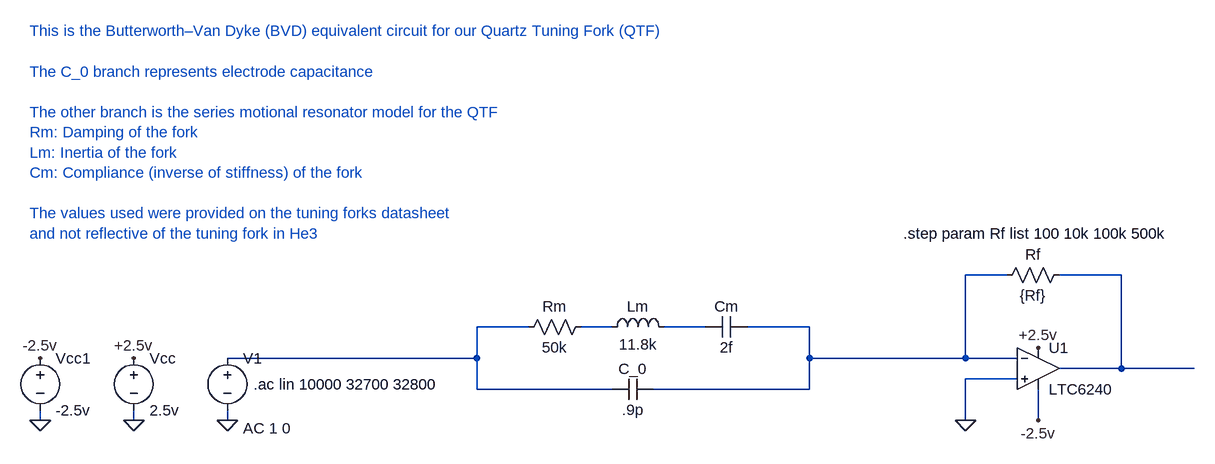
[diagram p0: schematic TuningForkModel.asc]
TuningForkModel.asc, the LTspice schematic file:
Version 4.1
SHEET 1 2036 680
WIRE 1440 16 1376 16
WIRE 1616 16 1520 16
WIRE 704 96 624 96
WIRE 832 96 784 96
WIRE 976 96 912 96
WIRE 1136 96 1040 96
WIRE 624 144 624 96
WIRE 624 144 240 144
WIRE 1136 144 1136 96
WIRE 1376 144 1376 16
WIRE 1376 144 1136 144
WIRE 1456 144 1376 144
WIRE 1616 160 1616 16
WIRE 1616 160 1520 160
WIRE 1728 160 1616 160
WIRE 1456 176 1376 176
WIRE 624 192 624 144
WIRE 832 192 624 192
WIRE 1136 192 1136 144
WIRE 1136 192 896 192
WIRE -48 240 -48 224
WIRE 96 240 96 224
WIRE 240 240 240 224
WIRE 1376 240 1376 176
WIRE 1488 240 1488 192
FLAG 96 144 +2.5v
FLAG 1376 240 0
FLAG 240 240 0
FLAG 96 240 0
FLAG -48 144 -2.5v
FLAG -48 240 0
FLAG 1488 240 -2.5v
FLAG 1488 128 +2.5v
SYMBOL voltage 240 128 R0
WINDOW 123 24 124 Left 2
WINDOW 39 0 0 Left 0
SYMATTR Value2 AC 1 0
SYMATTR InstName V1
SYMATTR Value ""
SYMBOL res 800 80 R90
WINDOW 0 0 56 VBottom 2
WINDOW 3 32 56 VTop 2
SYMATTR InstName Rm
SYMATTR Value 50k
SYMBOL ind 816 112 R270
WINDOW 0 32 56 VTop 2
WINDOW 3 5 56 VBottom 2
SYMATTR InstName Lm
SYMATTR Value 11.8k
SYMATTR SpiceLine Rser=1m
SYMBOL cap 1040 80 R90
WINDOW 0 0 32 VBottom 2
WINDOW 3 32 32 VTop 2
SYMATTR InstName Cm
SYMATTR Value 2f
SYMBOL cap 832 208 R270
WINDOW 0 32 32 VTop 2
WINDOW 3 0 32 VBottom 2
SYMATTR InstName C_0
SYMATTR Value .9p
SYMBOL voltage 96 128 R0
WINDOW 123 0 0 Left 0
WINDOW 39 0 0 Left 0
SYMATTR InstName Vcc
SYMATTR Value 2.5v
SYMBOL OpAmps\\LTC6240 1488 160 R0
SYMATTR InstName U1
SYMBOL res 1536 0 R90
WINDOW 0 0 56 VBottom 2
WINDOW 3 32 56 VTop 2
SYMATTR InstName Rf
SYMATTR Value {Rf}
SYMBOL voltage -48 128 R0
WINDOW 123 0 0 Left 0
WINDOW 39 0 0 Left 0
SYMATTR InstName Vcc1
SYMATTR Value -2.5v
TEXT 280 184 Left 2 !.ac lin 10000 32700 32800
TEXT 1280 -48 Left 2 !.step param Rf list 100 10k 100k 500k
TEXT -64 -360 Left 2 ;This is the Butterworth–Van Dyke (BVD) equivalent circuit for our Quartz Tuning Fork (QTF)\n \nThe C_0 branch represents electrode capacitance\n \nThe other branch is the series motional resonator model for the QTF\nRm: Damping of the fork\nLm: Inertia of the fork\nCm: Compliance (inverse of stiffness) of the fork\n \nThe values used were provided on the tuning forks datasheet\nand not reflective of the tuning fork in He3

The netlist it stands for:
* TuningForkModel.asc
V1 N003 0 AC 1 0
Rm N004 N003 50k
Lm N004 N005 11.8k Rser=1m
Cm N001 N005 2f
C_0 N003 N001 .9p
Vcc +2.5v 0 2.5v
* U1: LTC6240 (symbol OpAmps\LTC6240 not available, pins judged from their places): In+=0 In-=N001 V+=+2.5v V-=-2.5v OUT=N002
Rf N002 N001 {Rf}
Vcc1 -2.5v 0 -2.5v
.ac lin 10000 32700 32800
.step param Rf list 100 10k 100k 500k
* This is the Butterworth–Van Dyke (BVD) equivalent circuit for our Quartz Tuning Fork (QTF)
* The C_0 branch represents electrode capacitance
* The other branch is the series motional resonator model for the QTF
* Rm: Damping of the fork
* Lm: Inertia of the fork
* Cm: Compliance (inverse of stiffness) of the fork
* The values used were provided on the tuning forks datasheet
* and not reflective of the tuning fork in He3
.backanno
.end